# Altium project ActivePFC_400W_CCM_SiC.PrjPcb
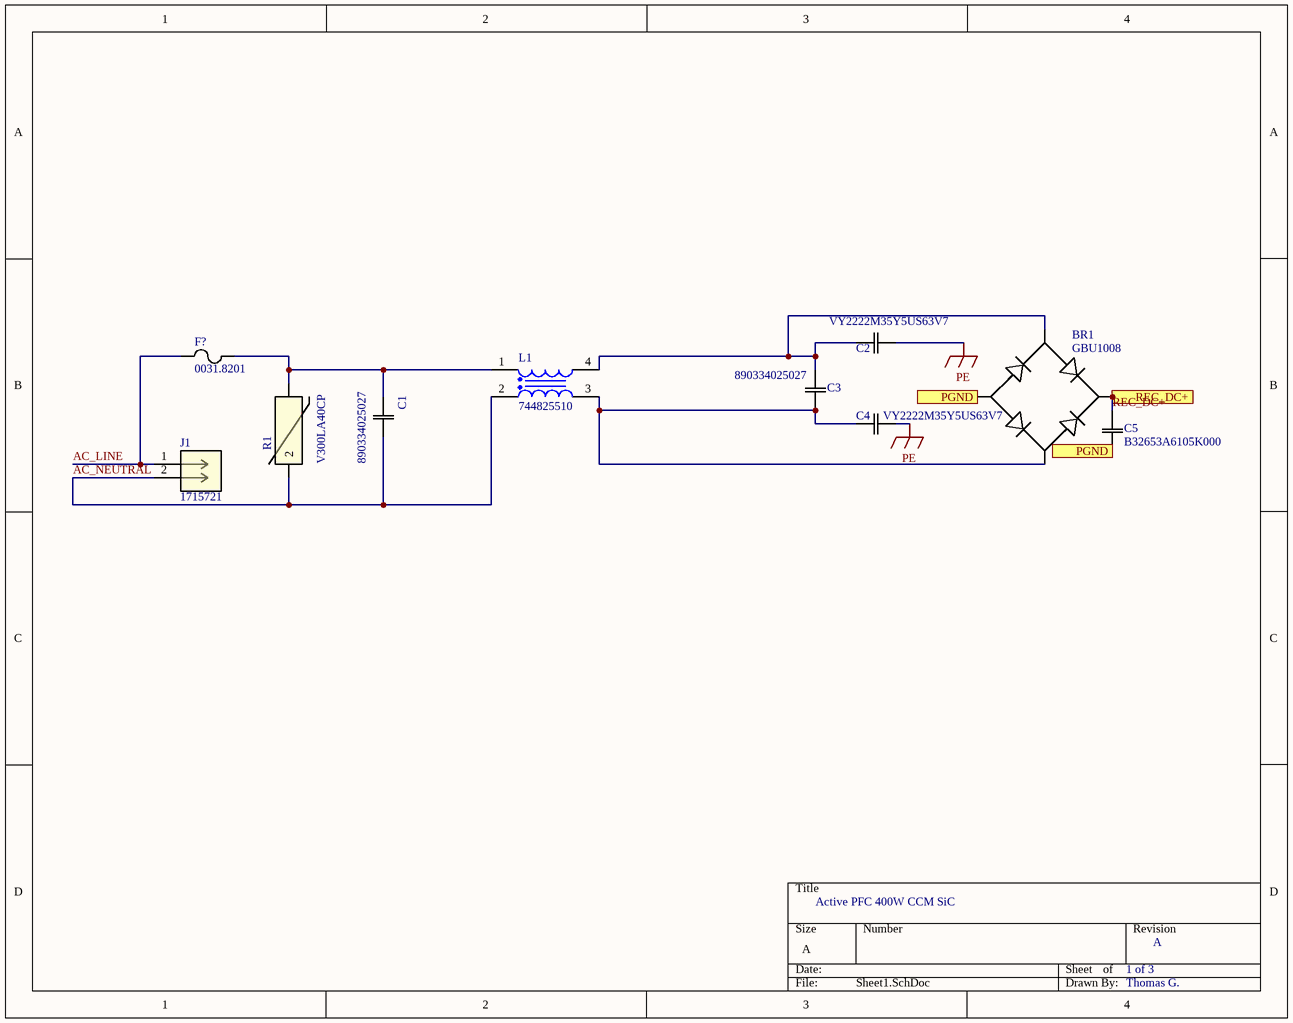
[diagram p0: Sheet1.SchDoc]
3 sheets, 32 parts. Net scope: flat (ports and power ports of the same name join across sheets).
Board file: PCB1.PcbDoc
Sheets:
  Sheet1.SchDoc
  Sheet2.SchDoc
  Sheet3.SchDoc

## Sheet Sheet1.SchDoc
size A; SheetNumber: 1; SheetTotal: 3

### Parts
BR1  GBU1008  [GBU_MTC]
C1  890334025027  [CAP_890334025027_WRE]
C2  VY2222M35Y5US63V7  [CAP_5US63V7_VIS]
C3  890334025027  [CAP_890334025027_WRE]
C4  VY2222M35Y5US63V7  [CAP_5US63V7_VIS]
C5  B32653A6105K000  [CAP_B32653A--22.5--14.5x29.5x26.5_TDK]
F?  0031.8201  [FUSE_0031.8201_SCH]
J1  1715721  [CONN_1715721_PXC]
L1  744825510  [WE-CMB_Type XL_L30W21H35]
R1  V300LA40CP  [MOV_C-III_V-LA-20D_LTF]

### Ports
PGND, REC_DC+

### Nets
PE: C2.2 C4.2
AC_LINE: F?.1 J1.1
AC_NEUTRAL: C1.1 J1.2 L1.2 R1.2
C6_R4: BR1.4 C5.1 ; port PGND
REC_DC+: BR1.1 C5.2 ; port REC_DC+
NetBR1_2: BR1.2 C2.1 C3.1 L1.4
NetBR1_3: BR1.3 C3.2 C4.1 L1.3
NetC1_2: C1.2 F?.2 L1.1 R1.1

### Notes on the sheet
- Active PFC 400W CCM SiC
- 1 of 3
- A
- Thomas G.

### Library data of the parts
BR1 = GBU1008: Description; Manufacturer_Name: Multicomp; Copyright: Copyright (C) 2026 Ultra Librarian. All rights reserved.; Manufacturer_Part_Number: GBU1008
C1 C3 = 890334025027: WCAP-FTXX X2 Film Capacitors (MKP); Manufacturer_Name: Wurth Electronics; Copyright: Copyright (C) 2026 Ultra Librarian. All rights reserved.; Manufacturer_Part_Number: 890334025027; Datasheet: https://www.we-online.com/catalog/datasheet/890334025027.pdf
C2 C4 = VY2222M35Y5US63V7: VY2 X440Y300VAC 2,2nF Â±20% Y5U BULK e3; Manufacturer_Name: Vishay; Copyright: Copyright (C) 2025 Ultra Librarian. All rights reserved.; Manufacturer_Part_Number: VY2222M35Y5US63V7
C5 = B32653A6105K000: No Description Available; Manufacturer_Name: TDK; Copyright: Copyright (C) 2026 Ultra Librarian. All rights reserved.; Manufacturer_Part_Number: B32653A6105K000
F? = 0031.8201: Description; Manufacturer_Name: Schurter Inc; Copyright: Copyright (C) 2025 Ultra Librarian. All rights reserved.; Manufacturer_Part_Number: 0031.8201
J1 = 1715721: PCB terminal block, nominal current: 17.5 A, rated voltage (III/2): 400 V, nominal cross section: 1.5 mmÂ², number of potentials: 2, number of rows: 1, number of positions per row: 2, product range: MKDS 1,5, pitch: 5.08 mm, connection method: Screw connection with tension sleeve, screw head form: L Slotted, mounting: Wave soldering, conductor/PCB connection direction: 0 Â°, color: green, Pin layout: Linear pinning, Solder pin [P]: 3.5 mm, number of solder pins per potential: 1, type of packaging: packed in cardboard. The article can be aligned to create different nos. of positions!; Manufacturer_Name: Phoenix Contact; Copyright: Copyright (C) 2025 Ultra Librarian. All rights reserved.; Manufacturer_Part_Number: 1715721; RefDes: RefDes; Type: Type
L1 = CMP-0223-00079-2: NexarPartId: 22865138; Resistance: 55mΩ; Inductance Tolerance: 30%; Inductance: 10mH; RoHS: Compliant; Packaging: Bulk; Number of Pins: 4
R1 = V300LA40CP: Description; Manufacturer_Name: Littelfuse Inc; Copyright: Copyright (C) 2025 Ultra Librarian. All rights reserved.; Manufacturer_Part_Number: V300LA40CP

## Sheet Sheet2.SchDoc
size A; SheetNumber: 2; SheetTotal: 3
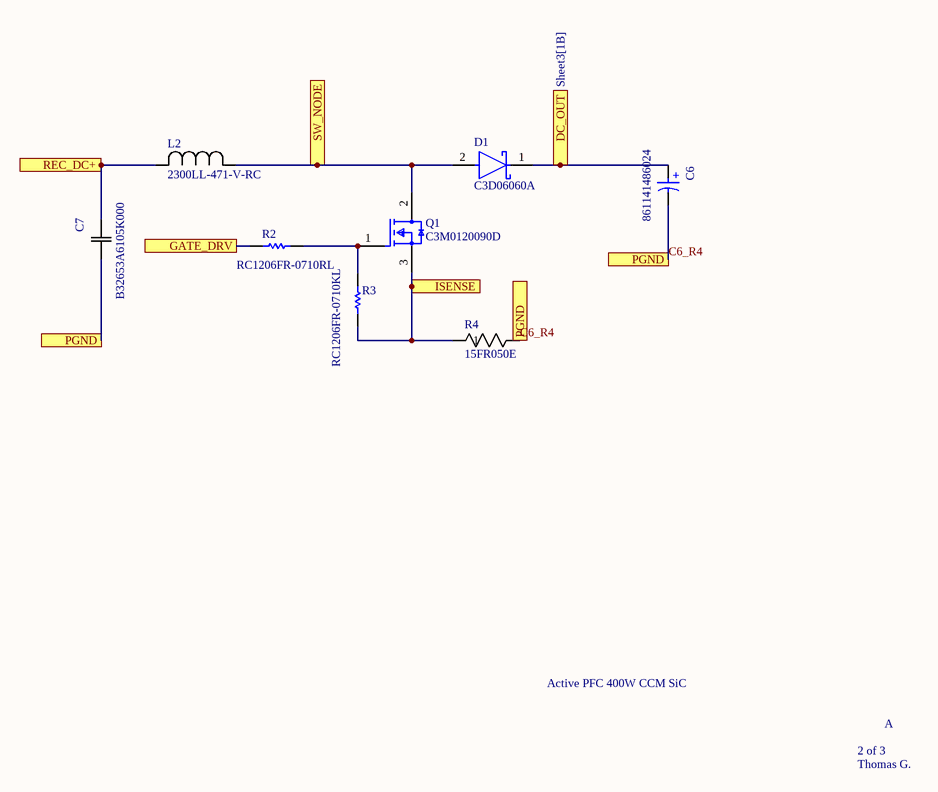
[diagram p1: Sheet2.SchDoc]

### Parts
C6  861141486024  [WCAP-AI3H_D35H50]
C7  B32653A6105K000  [CAP_B32653A--22.5--14.5x29.5x26.5_TDK]
D1  C3D06060A  [FP-TO-220-2-MFG]
L2  2300LL-471-V-RC  [IND_2300LL-V_52_34]
Q1  C3M0120090D  [FP-TO-247-3-MFG]
R2  RC1206FR-0710RL  [RESC3116X65X40ML10T20]
R3  RC1206FR-0710KL  [RESC3116X65X40ML10T20]
R4  15FR050E  [RES_15_OHM]

### Ports
DC_OUT (see Sheet3[1B]), GATE_DRV, ISENSE, PGND, REC_DC+, SW_NODE

### Nets
C6_R4: C6.2(N) C7.1 R4.2 ; port PGND
REC_DC+: C7.2 L2.2 ; port REC_DC+
NetC6_1: C6.1(P) D1.1(C) ; port DC_OUT
NetD1_2: D1.2(A) L2.1 Q1.2(D) ; port SW_NODE
NetQ1_1: Q1.1(G) R2.2 R3.2
NetQ1_3: Q1.3(S) R3.1 R4.1 ; port ISENSE
NetR2_1: R2.1 ; port GATE_DRV

### Notes on the sheet
- Active PFC 400W CCM SiC
- 2 of 3
- A
- Thomas G.
- (in symbol CMP-03913-54202429-3) +

### Library data of the parts
C6 = CMP-03913-54202429-3: Electrolytic Capacitor, Snap-in, WCAP-AI3H Series, 470 F, 20%, 450 V, 35 mm RoHS Compliant: Yes; Manufacturer Lifecycle Status: ACTIVE; Ripple Current: 1.85A; Life (Hours): 3000hours; Voltage Rating (DC): 450V; YEOL: 1 = Estimated lifetime > 10 years; ESR (Equivalent Series Resistance): 195mΩ; Pitch: 10mm; Capacitance: 470µF; Polarity: Polar; Leakage Current: 1.37967mA; Length: 52mm; Lifecycle Status: Production; Diameter: 35mm; Max Operating Temperature: 105°C; Min Operating Temperature: -25°C; Case/Package: Radial; RoHS: Compliant; Mount: Through Hole; REACH SVHC: Unknown; Lead Pitch: 10.0076mm; Voltage Rating: 450V; Height - Seated (Max): 54.0004mm; Height: 52mm; Tolerance: 20%
C7 = B32653A6105K000: as C5 on sheet Sheet1; Copyright: Copyright (C) 2026 Ultra Librarian. All rights reserved.; Manufacturer_Part_Number: B32653A6105K000
D1 = CMP-240925-000090-2: DIODE SCHOTTKY 600V 6A TO220-2; Average Rectified Current: 19A; Forward Voltage: 1.8V; Element Configuration: Single; Max Reverse Current: 50uA; Max Power Dissipation: 79W; Reverse Recovery Time: 0ns; Max Forward Surge Current (Ifsm): 70A; Width: 4.699mm; Number of Pins: 2; Max Operating Temperature: 175°C; Min Operating Temperature: -55°C; Length: 10.41mm; Max Repetitive Reverse Voltage (Vrrm): 600V; Package Quantity: 50; Series: Z-Rec®; Case/Package: TO-220; Forward Current: 6A; Radiation Hardening: No; Max Reverse Voltage (DC): 600V; Height: 15.621mm; RoHS Compliant: Yes; Peak Non-Repetitive Surge Current: 70A; Packaging: Rail/Tube; Mount: Through Hole
L2 = 2300LL-471-V-RC: No Description Available; Manufacturer_Name: Bourns Electronics; Copyright: Copyright (C) 2026 Ultra Librarian. All rights reserved.; Manufacturer_Part_Number: 2300LL-471-V-RC
Q1 = CMP-240936-000102-3: SICFET N-CH 900V 23A TO247-3; Input Capacitance: 350pF; Rds On Max: 155mR; Threshold Voltage: 2.1V; Max Power Dissipation: 97W; RoHS Compliant: Yes; Drain to Source Voltage (Vdss): 900V; Mount: Through Hole; Series: C3M™; Packaging: Rail/Tube; Case/Package: TO-247-3; Max Operating Temperature: 150°C; Min Operating Temperature: -55°C; Number of Pins: 3; Continuous Drain Current (ID): 23A; Reach SVHC Compliant: Yes
R2 = CMP-2100-03677-1: Chip Resistor, 10 Ohm, +/- 1%, 0.25 W, -55 to 155 degC, 1206 (3216 Metric), RoHS, Tape and Reel; Manufacturer: Yageo; Voltage Rating (DC): 200V; Resistance: 10Ohm; Power Rating: 250mW; Temperature Coefficient: 200ppm/degreesC; Military Standard: Not; Package Description: 2-Pin Surface Mount Device, Body 3.1 x 1.6 mm; Packaging: TapeandReel; Datasheet Version: Rev. 5, 10/2016; Length: 3.1mm; Manufacturer URL: http://www.yageo.com/; Voltage Rating: 200V; Height: 0.026inch; REACH SVHC: Unknown; Max Operating Temperature: 155degC; Case Code (Imperial): 1206; Package Reference: 1206.0; RoHSCompliant: true; Termination: SMD/SMT; Lead Free: LeadFree; Composition: ThickFilm; Tolerance: 1%; Package Quantity: 1; Min Operating Temperature: -55degC; Datasheet URL: http://www.yageo.com/NewPortal/yageodocoutput?fileName=/pdf/R-Chip/PYu-RC_Group_51_RoHS_L_5.pdf; Number of Pins: 2; Width: 0.063inch; Case Code (Metric): 3216; Max Power Dissipation: 250mW; Depth: 1.6mm; Number of Terminations: 2; Case/Package: 1206
R3 = CMP-1014-00623-2: Chip Resistor, 10 KOhm, +/- 1%, 0.25 W, -55 to 155 degC, 1206 (3216 Metric), RoHS, Tape and Reel; Manufacturer: Yageo; Voltage Rating: 200V; Resistance: 10KOhm; Temperature Coefficient: 100ppm/degreesC; Power Rating: 250mW; Packaging: TapeandReel; Termination: SMD/SMT; REACH SVHC: Unknown; Tolerance: 1%; Height: 0.55mm; Composition: ThickFilm; Max Operating Temperature: 155degC; Datasheet Version: Rev. 5, 10/2016; Lead Free: LeadFree; Case Code (Metric): 3216; Depth: 1.6mm; Package Quantity: 5000; RoHSCompliant: true; Military Standard: Not; Case/Package: 1206; Case Code (Imperial): 1206; Min Operating Temperature: -55degC; Datasheet URL: http://www.yageo.com/NewPortal/yageodocoutput?fileName=/pdf/R-Chip/PYu-RC_Group_51_RoHS_L_5.pdf; Length: 3.1mm; Manufacturer URL: http://www.yageo.com/; Package Reference: 1206.0; Width: 1.6mm; Package Description: 2-Pin Surface Mount Device, Body 3.1 x 1.6 mm
R4 = 15FR050E: Description; Manufacturer_Name: Ohmite; Copyright: Copyright (C) 2025 Ultra Librarian. All rights reserved.; Manufacturer_Part_Number: 15FR050E

## Sheet Sheet3.SchDoc
size A; SheetNumber: 3; SheetTotal: 3
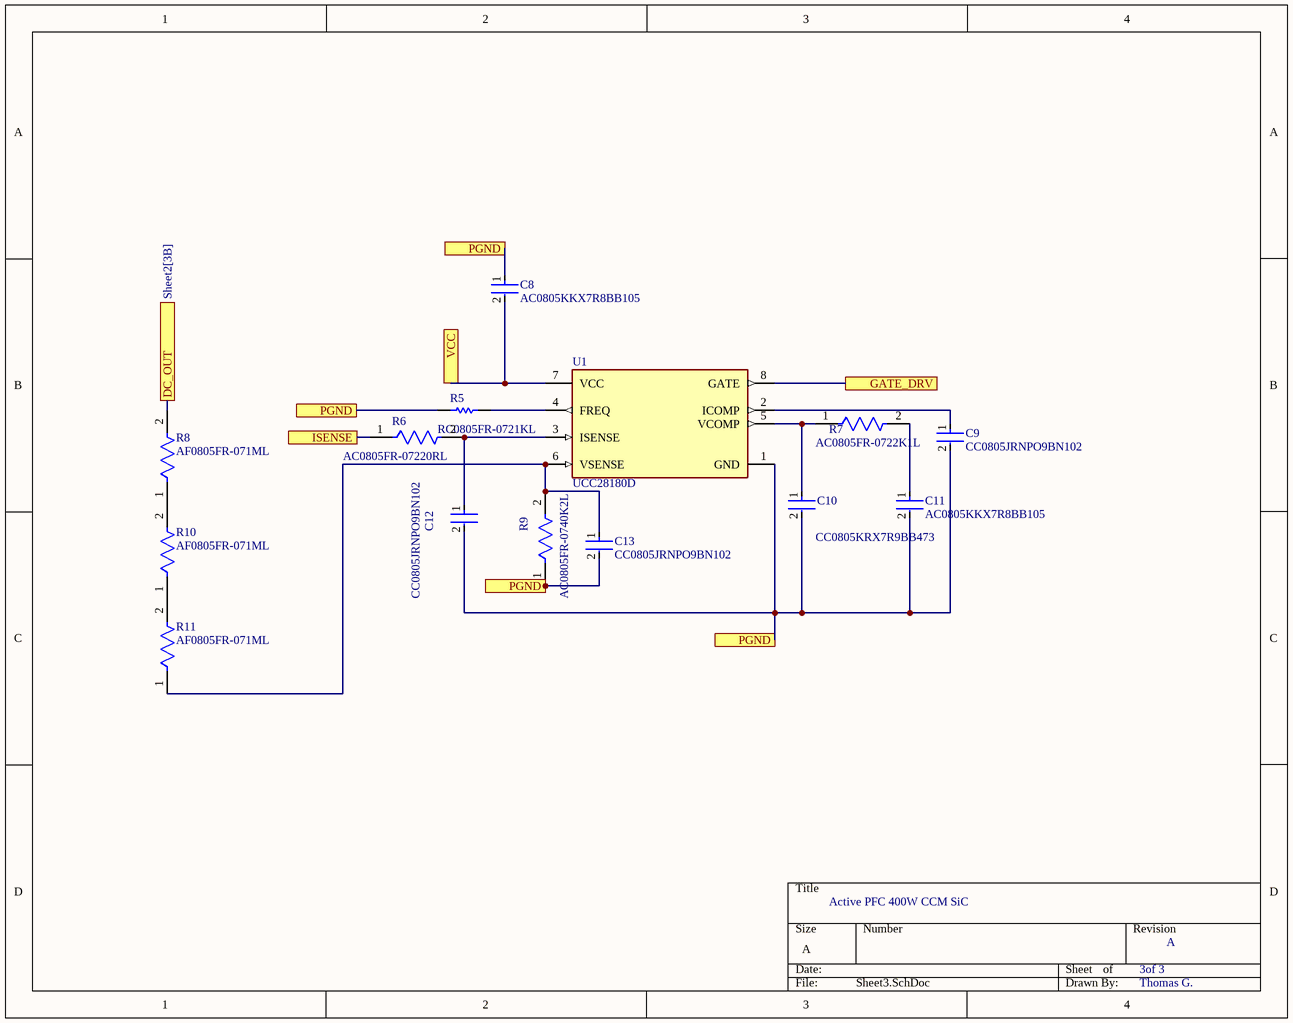
[diagram p2: Sheet3.SchDoc]

### Parts
C8  AC0805KKX7R8BB105  [FP-AC0805-0_85-MFG]
C9  CC0805JRNPO9BN102  [FP-CC0805-0_1-0_7-MFG]
C10  CC0805KRX7R9BB473  [FP-CC0805-0_85-MFG]
C11  AC0805KKX7R8BB105  [FP-AC0805-0_85-MFG]
C12  CC0805JRNPO9BN102  [FP-CC0805-0_1-0_7-MFG]
C13  CC0805JRNPO9BN102  [FP-CC0805-0_1-0_7-MFG]
R5  RC0805FR-0721KL  [RESC2013X60X35NL10T20]
R6  AC0805FR-07220RL  [FP-AC0805-MFG]
R7  AC0805FR-0722K1L  [FP-AC0805-MFG]
R8  AF0805FR-071ML  [FP-AF0805-MFG]
R9  AC0805FR-0740K2L  [FP-AC0805-MFG]
R10  AF0805FR-071ML  [FP-AF0805-MFG]
R11  AF0805FR-071ML  [FP-AF0805-MFG]
U1  UCC28180D  [FP-D0008A-MFG]

### Ports
DC_OUT (see Sheet2[3B]), GATE_DRV, ISENSE, PGND, VCC

### Nets
C6_R4: C8.1 C9.2 C10.2 C11.2 C12.2 C13.2 R5.1 R9.1 U1.1(GND) ; port PGND
NetC6_1: R8.2 ; port DC_OUT
NetC8_2: C8.2 U1.7(VCC) ; port VCC
NetC9_1: C9.1 U1.2(ICOMP)
NetC10_1: C10.1 R7.1 U1.5(VCOMP)
NetC11_1: C11.1 R7.2
NetC12_1: C12.1 R6.2 U1.3(ISENSE)
NetC13_1: C13.1 R9.2 R11.1 U1.6(VSENSE)
NetQ1_3: R6.1 ; port ISENSE
NetR2_1: U1.8(GATE) ; port GATE_DRV
NetR5_2: R5.2 U1.4(FREQ)
NetR8_1: R8.1 R10.2
NetR10_1: R10.1 R11.2

### Notes on the sheet
- Active PFC 400W CCM SiC
- 3of 3
- A
- Thomas G.

### Library data of the parts
C8 C11 = CMP-03422-000021-1: CAP CER 1UF 25V X7R 0805; Manufacturer: Yageo; Material: Ceramic; Temperature Coefficient: 15%; Tolerance: 0.1; Automotive Grade: Grade 1; Device Class L2: Capacitors; Height: 0.95mm; Manufacturer Part Number: AC0805KKX7R8BB105; Voltage Rating: 25 V; Capacitance: 1 uF; Automotive: Yes; Temperature Range Low: -55°C; ComponentLink2Description: Datasheet; RoHS: TRUE; ComponentLink2URL: http://www.yageo.com/documents/recent/UPY-AC_NP0X7R_16V-to-630V_12.pdf; Device Class L3: Ceramic Capacitors; Temperature Characteristic: X7R; Package: AC0805-0.85; Mouser Description: AC Series 0805 25 V 1 uF ±10% X7R Multilayer Ceramic Capacitor; Temperature: -55°C to +125°C; Octopart: https://octopart.com/ac0805kkx7r8bb105-yageo-75656631; Device Class L1: Passive Components; Category: Cap; Footprint Url: http://www.yageo.com/exep/pages/download/literatures/UPY-C_GEN_24.pdf; Ipc Land Pattern Name: CAPC200125X85; Temperature Range High: +125°C; Lead Free: Yes; Digikey Description: CAP CER 1UF 25V X7R 0805; Value: 1 uF
C9 C12 C13 = CMP-03422-001491-1: CAP CER 1000PF 50V C0G/NPO 0805; Dielectric Material: Ceramic; Dielectric: C0G; Temperature Coefficient: 30ppm/°C; Insulation Resistance: 10GR; Dissipation Factor: 0.1%; Capacitance: 1nF; Tolerance: 5%; Height: 0.6mm; Case/Package: 0805; Lead Free: Lead Free; Case Code (Metric): 2012; Length: 2mm; Max Operating Temperature: 125°C; Depth: 1.25mm; Thickness: 0.024inch; Width: 0.049inch; Series: CC; Voltage Rating: 50V; Package Quantity: 4000; Min Operating Temperature: -55°C; Termination: SMD/SMT; Radiation Hardening: No; Mount: Surface Mount; Packaging: Tape and Reel; Voltage Rating (DC): 50V; Case Code (Imperial): 0805; Resistor Type: Ceramic; RoHS Compliant: Yes; Voltage: 50V; REACH SVHC: No SVHC
C10 = CMP-03422-000052-1: CAP CER 0.047UF 50V X7R 0805; Manufacturer: Yageo; Value: 47 nF; Tolerance: 0.1; Material: Ceramic; Footprint Url: http://www.yageo.com/exep/pages/download/literatures/UPY-C_GEN_24.pdf; ComponentLink2URL: http://www.yageo.com/documents/recent/UPY-GPHC_Y5V_6.3V-to-50V_8.pdf; Ipc Land Pattern Name: CAPC200125X85; Manufacturer Part Number: CC0805KRX7R9BB473; Digikey Description: CAP CER 0.047UF 50V X7R 0805; Lead Free: Yes; Octopart: https://octopart.com/cc0805krx7r9bb473-yageo-42181304; Voltage Rating: 50 V; RoHS: TRUE; ComponentLink2Description: Datasheet; Temperature Range High: +85°C; Package: CC0805-0.85; Temperature Range Low: -30°C; Device Class L2: Capacitors; Device Class L3: Ceramic Capacitors; Height: 0.95mm; Temperature: -30°C to +85°C; Category: Cap; Device Class L1: Passive Components; Capacitance: 47 nF; Temperature Characteristic: X7R; Automotive: No; Mouser Description: Multilayer Ceramic Capacitors MLCC - SMD/SMT 47nF 50V X7R 10%
R5 = CMP-2001-01013-1: Manufacturer: Yageo; Part Number: RC0805FR-0721KL
R6 = CMP-2001-04488-2: RES SMD 220 OHM 1% 1/8W 0805; Manufacturer: Yageo; Value: 220Ω; Tolerance: 0.01; Voltage Rating: 150V; Automotive Grade: Grade 0; Automotive: Yes; Composition: Thick Film; Lead Free: Yes; Octopart: https://octopart.com/ac0805fr-07220rl-yageo-26041145; Series: AC; Device Class L1: Passive Components; Temperature: -55°C to +155°C; Device Class L3: Chip SMD Resistors; Package: AC0805; Digikey Description: RES SMD 220 OHM 1% 1/8W 0805; ComponentLink2URL: http://www.yageo.com/documents/recent/PYu-AC_51_RoHS_L_6.pdf; ComponentLink2Description: Datasheet; Resistance: 220Ω; Mouser Description: Thick Film Resistors - SMD 1/8W 220ohm 1% AEC-Q200; Ipc Land Pattern Name: RESC200125X50; Power Rating: 1/8W; Device Class L2: Resistors; Category: Res; Footprint Url: http://www.yageo.com/exep/pages/download/literatures/PYu-R_Mount_10.pdf; Manufacturer Part Number: AC0805FR-07220RL; Temperature Range Low: -55°C; Height: 0.6mm; Temperature Range High: +155°C; RoHS: TRUE
R7 = CMP-03412-037565-1: RES SMD 22.1K OHM 1% 1/8W 0805; Manufacturer: Yageo; Resistance: 22.1KΩ; Value: 22.1KΩ; Voltage Rating: 150V; Tolerance: 0.01; Automotive Grade: Grade 0; Ipc Land Pattern Name: RESC200125X50; Series: AC; RoHS: TRUE; Temperature Range Low: -55°C; Composition: Thick Film; Mouser Description: Res Thick Film 0805 22.1K Ohm 1% 1/8W ±100ppm/°C Molded SMD Paper T/R; Octopart: https://octopart.com/ac0805fr-0722k1l-yageo-71367622; Category: Res; ComponentLink2URL: http://www.yageo.com/documents/recent/PYu-AC_51_RoHS_L_6.pdf; Device Class L3: Chip SMD Resistors; Height: 0.6mm; ComponentLink2Description: Datasheet; Automotive: Yes; Lead Free: Yes; Power Rating: 1/8W; Device Class L2: Resistors; Manufacturer Part Number: AC0805FR-0722K1L; Package: AC0805; Digikey Description: RES SMD 22.1K OHM 1% 1/8W 0805; Footprint Url: http://www.yageo.com/exep/pages/download/literatures/PYu-R_Mount_10.pdf; Temperature: -55°C to +155°C; Device Class L1: Passive Components; Temperature Range High: +155°C
R8 R10 R11 = CMP-03412-037889-1: Anti-Sulfurated Chip Resistor Automotive Grade 1MΩ 1% 0.125W ±100ppm/°C 0805; Resistance: 1MR; Max Power Dissipation: 125mW; Height: 0.024inch; Packaging: Tape and Reel; Tolerance: 1%; Series: AF; Features: Moisture Resistant; Width: 0.049inch; Resistor Type: Thick Film; Number of Terminations: 2; RoHS Compliant: Yes; Max Operating Temperature: 155°C; Case/Package: 0805; Temperature Coefficient: 100ppm/°C; Min Operating Temperature: -55°C; Length: 0.079inch
R9 = CMP-03412-037646-1: RES SMD 40.2K OHM 1% 1/8W 0805; Manufacturer: Yageo; Resistance: 40.2KΩ; Tolerance: 0.01; Voltage Rating: 150V; Automotive Grade: Grade 0; Value: 40.2KΩ; Temperature Range Low: -55°C; Composition: Thick Film; Device Class L1: Passive Components; Temperature Range High: +155°C; Digikey Description: RES SMD 40.2K OHM 1% 1/8W 0805; Manufacturer Part Number: AC0805FR-0740K2L; Height: 0.6mm; Category: Res; ComponentLink2Description: Datasheet; Automotive: Yes; Ipc Land Pattern Name: RESC200125X50; Footprint Url: http://www.yageo.com/exep/pages/download/literatures/PYu-R_Mount_10.pdf; Temperature: -55°C to +155°C; RoHS: TRUE; Series: AC; Device Class L3: Chip SMD Resistors; Octopart: https://octopart.com/ac0805fr-0740k2l-yageo-30510925; Package: AC0805; Lead Free: Yes; Device Class L2: Resistors; Power Rating: 1/8W; ComponentLink2URL: http://www.yageo.com/documents/recent/PYu-AC_51_RoHS_L_6.pdf
U1 = CMP-04918-000038-1: IC PFC CTRLR AVERAGE CURR 8SOIC; Manufacturer: Texas Instruments; Max Supply Voltage: 21V; Output Type: Fixed; Max Duty Cycle: 98%; Number Of Outputs: 1; Output Voltage: 390mV; Standoff Height: 0.11mm; Output Current: 40uA; Nominal Supply Current: 7mA; Switching Frequency: 65kHz; Max Junction Temp: +125°C; Switching Topology: Buck; Lead Free: Yes; Height: 1.75mm; Automotive: No; Category: IC; Device Class L1: Integrated Circuits (ICs); Octopart: https://octopart.com/ucc28180d-texas+instruments-31566950; Mouser Description: Power Factor Correction - PFC 8-PIN CCM PFC CONTROLLER; Ipc Land Pattern Name: SOIC127P600X175-8; RoHS: TRUE; Temperature: -40°C to +125°C; Package: D0008A; Temperature Range High: +125°C; Device Class L3: Voltage Regulators - Switching; ComponentLink2Description: Datasheet; Device Class L2: Power Management ICs; Manufacturer Part Number: UCC28180D; Temperature Range Low: -40°C; Digikey Description: IC PFC CTRLR AVERAGE CURR 8SOIC; ComponentLink2URL: http://www.ti.com/lit/ds/symlink/ucc28180.pdf

## Nets that join several sheets
C6_R4: Sheet1 (BR1.4 C5.1), Sheet2 (C6.2 C7.1 R4.2), Sheet3 (9 pins)
NetC6_1: Sheet2 (C6.1 D1.1), Sheet3 (R8.2)
NetQ1_3: Sheet2 (Q1.3 R3.1 R4.1), Sheet3 (R6.1)
NetR2_1: Sheet2 (R2.1), Sheet3 (U1.8)
REC_DC+: Sheet1 (BR1.1 C5.2), Sheet2 (C7.2 L2.2)